# EasyEDA Pro project ProPrj_RUSH - SATURN - v3_2026-11-09.epro

# Schematic Schematic1
Board Name: Board1; Create Date: 2026-11-04; Page Name: P1; Project Name: RUSH - corrigido; Schematic Name: Schematic1; Update Date: 2026-11-06; Company: EasyEDA.com; Drawn: Erick; Page Size: A4; Version: V1.0
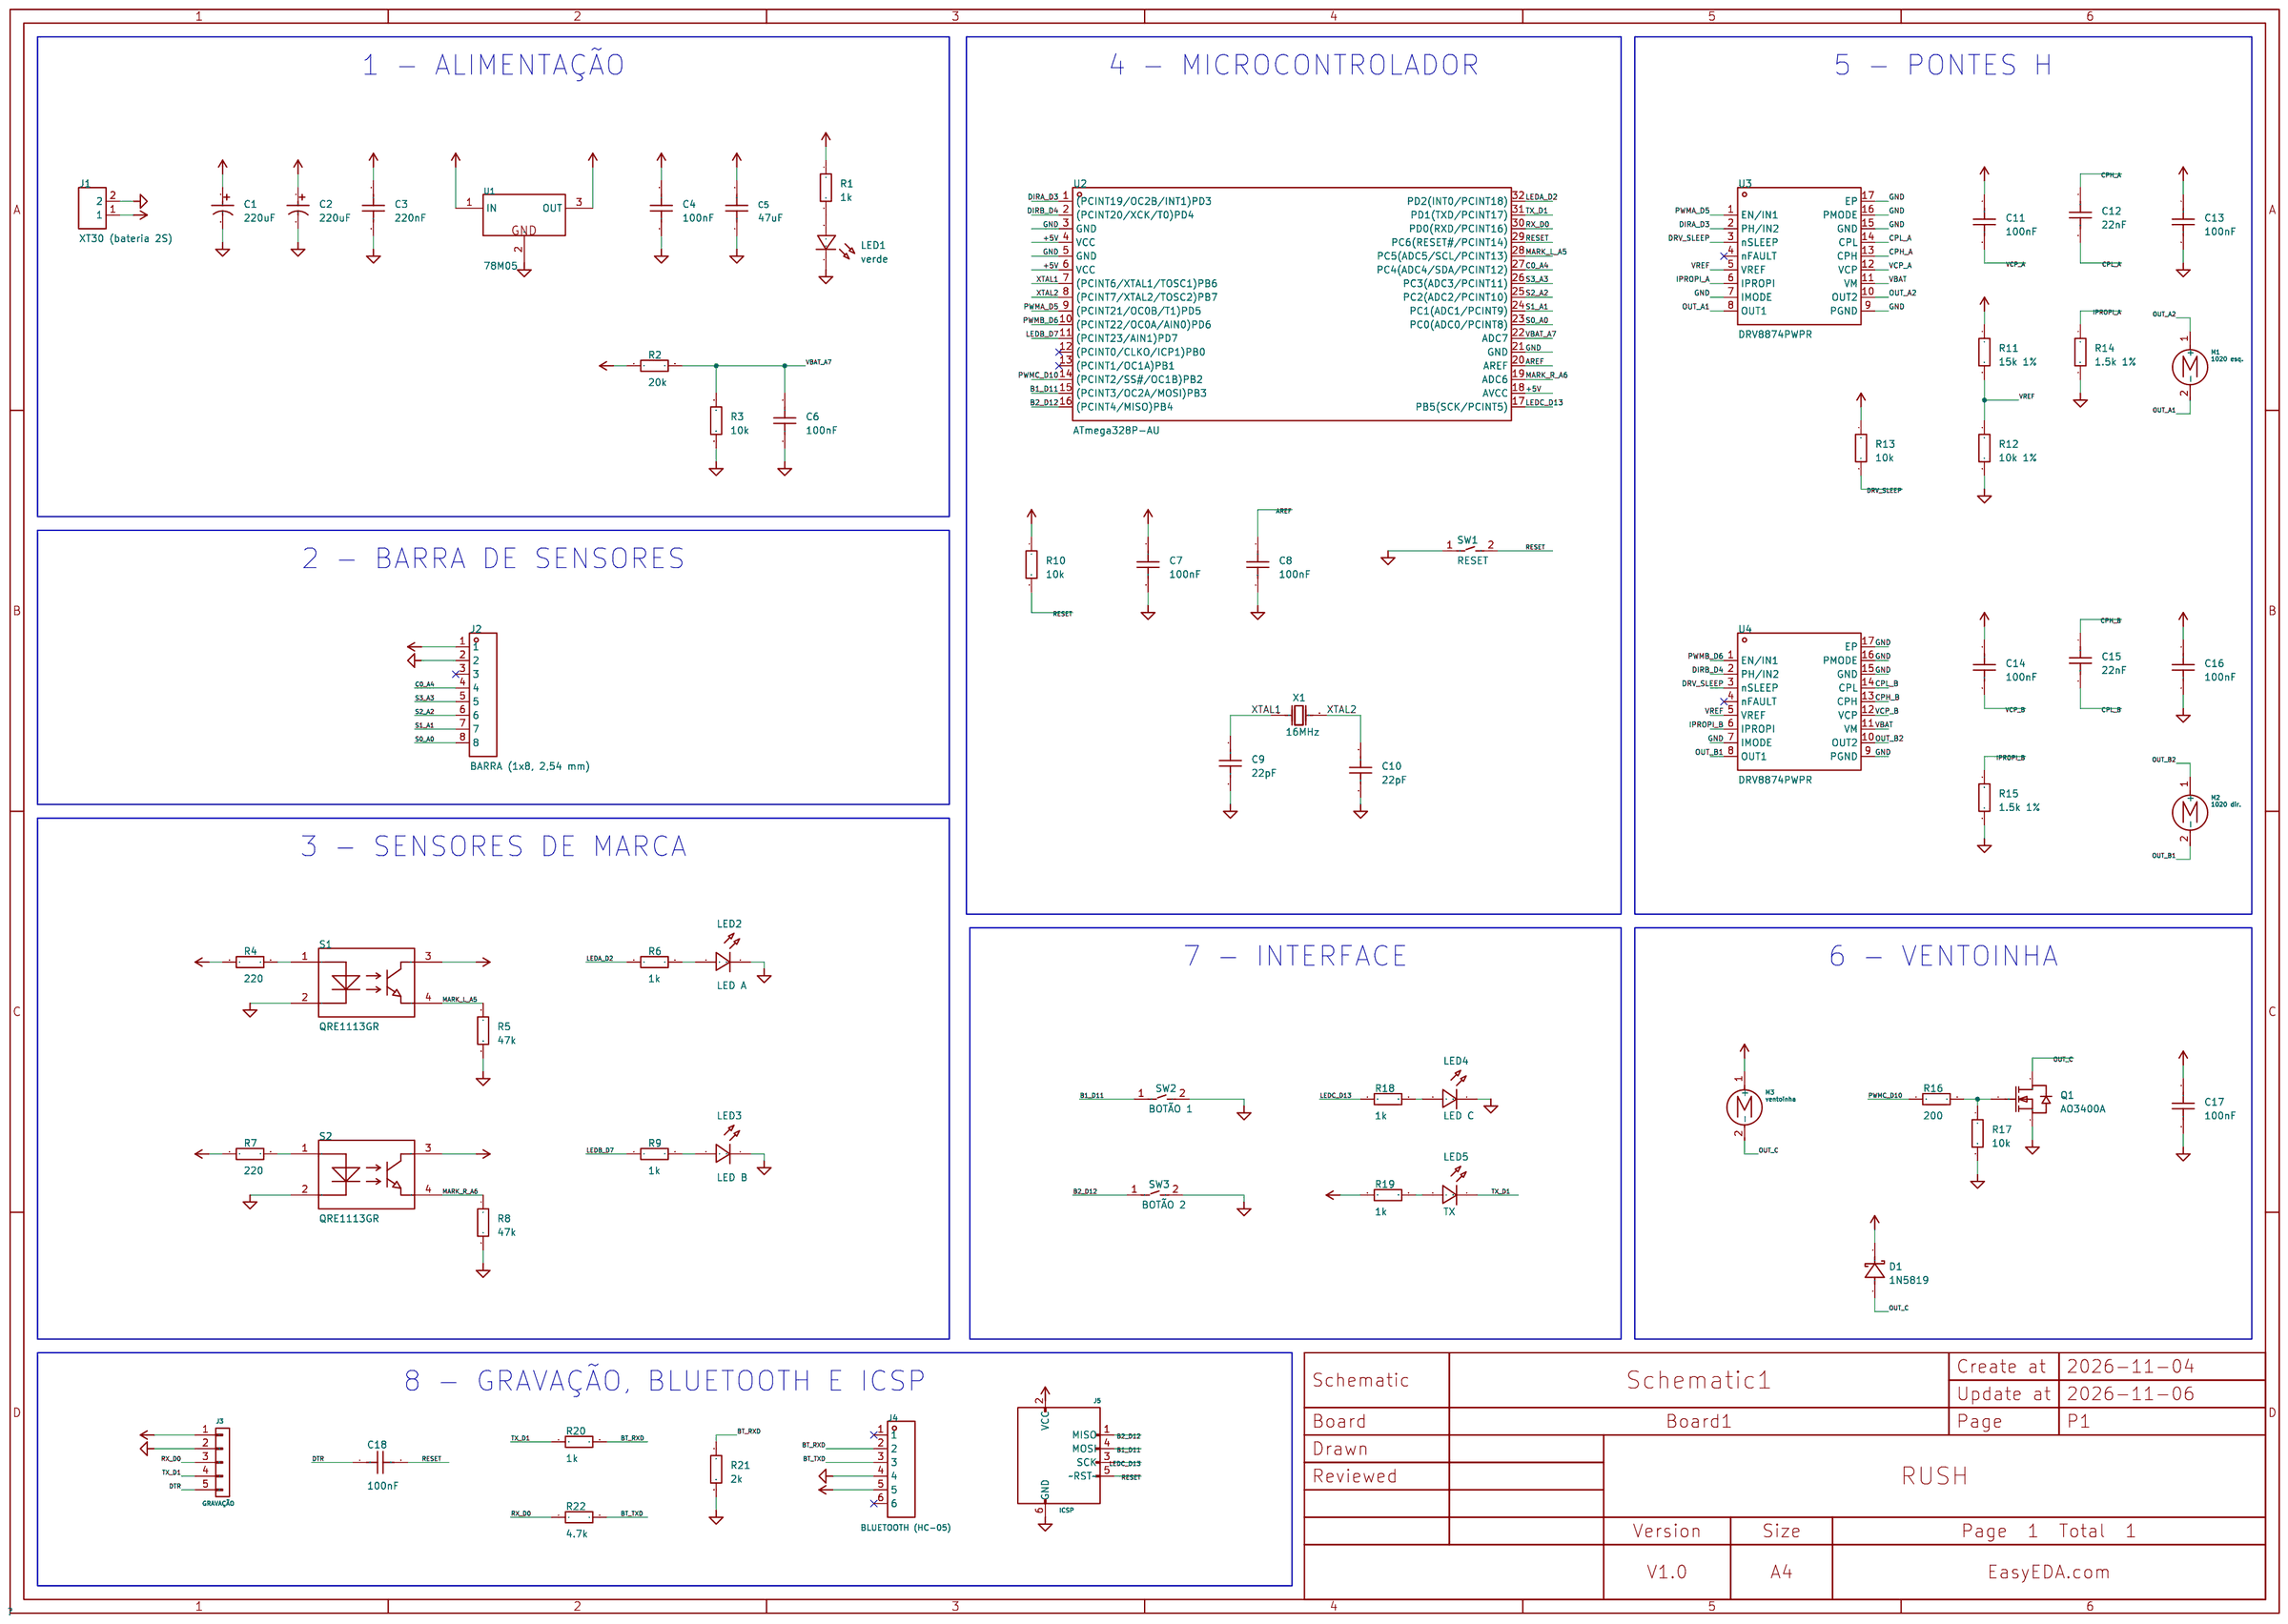
[diagram p0: schematic sheet]

## Parts
C1  220uF  [CAP-TH_BD6.3-P2.50-D1.0-FD]
C2  220uF  [CAP-TH_BD6.3-P2.50-D1.0-FD]
C3  220nF  [C0603]
C4  100nF  [C0603]
C5  47uF  [C1210]
C6  100nF  [C0603]
C7  100nF  [C0603]
C8  100nF  [C0603]
C9  22pF  [C0603]
C10  22pF  [C0603]
C11  100nF  [C0603]
C12  22nF  [C0603]
C13  100nF  [C0603]
C14  100nF  [C0603]
C15  22nF  [C0603]
C16  100nF  [C0603]
C17  100nF  [C0603]
C18  100nF  [C0603]
D1  1N5819  [SOD-123_L2.7-W1.6-LS3.7-RD-1]
J1  XT30 (bateria 2S)  [CONN-TH_XT30U-M]
J2  BARRA (1x8, 2,54 mm)  [HDR-TH_8P-P2.54-V-M]
J3  GRAVAÇÃO  [seguidor_alpha:HDR_1x05_P2.54_SMD_DEITADA]
J4  BLUETOOTH (femea 1x6, ordem HC-05)  [HDR-TH_6P-P2.54-V-F]
J5  ICSP  [seguidor_alpha:ICSP_6P_SMD_BOT]
LED1  verde  [LED0603-RD_GREEN]
LED2  LED A  [LED0603-RD_GREEN]
LED3  LED B  [LED0603-RD_GREEN]
LED4  LED C  [LED0603-RD_GREEN]
LED5  TX  [LED0603-RD_GREEN]
M1  1020 esq.  [seguidor_alpha:MOTOR_1020_2P]
M2  1020 dir.  [seguidor_alpha:MOTOR_1020_2P]
M3  ventoinha  [seguidor_alpha:MOTOR_1020_2P]
Q1  AO3400A  [SOT-23-3_L2.9-W1.3-P1.90-LS2.4-BR]
R1  1k  [R0603]
R2  20k 1%  [R0603]
R3  10k 1%  [R0603]
R4  220  [R0603]
R5  47k  [R0603]
R6  1k  [R0603]
R7  220  [R0603]
R8  47k  [R0603]
R9  1k  [R0603]
R10  10k  [R0603]
R11  15k 1%  [R0603]
R12  10k 1%  [R0603]
R13  10k  [R0603]
R14  1.5k 1%  [R0603]
R15  1.5k 1%  [R0603]
R16  200  [R0603]
R17  10k  [R0603]
R18  1k  [R0603]
R19  1k  [R0603]
R20  1k  [R0603]
R21  2k  [R0603]
R22  4.7k  [R0603]
S1  QRE1113GR  [OPTO-SMD_QRE1113GR]
S2  QRE1113GR  [OPTO-SMD_QRE1113GR]
SW1  RESET  [KEY-SMD_L6.1-W3.7-LS8.0-2]
SW2  BOTÃO 1  [KEY-SMD_L6.1-W3.7-LS8.0-2]
SW3  BOTÃO 2  [KEY-SMD_L6.1-W3.7-LS8.0-2]
U1  78M05  [TO-252-2_L6.5-W6.1-P4.58-LS10.0-TL]
U2  ATmega328P-AU  [TQFP-32_L7.0-W7.0-P0.80-LS9.0-BL]
U3  DRV8874PWPR  [HTSSOP-16_L5.0-W4.4-P0.65-LS6.4-BL-EP]
U4  DRV8874PWPR  [HTSSOP-16_L5.0-W4.4-P0.65-LS6.4-BL-EP]
X1  16MHz  [CRYSTAL-SMD_L5.0-W3.2]

## Library data of the parts
C1 C2 = KM221M025E110A: entre os pes da carcaca, como no EVA-RT; LCSC Part Name: 220uF ±20% 25V; Supplier Part: C59416; Manufacturer: CapXon(丰宾); Supplier Footprint: 插件,D6.3xL11mm; JLCPCB Part Class: Extended Part; Datasheet: https://item.szlcsc.com/datasheet/KM221M025E110A/60469.html; Supplier: LCSC; Tolerance: ±20%; Voltage Rating: 25V; Ripple Current: 235mA@120Hz; Pin Spacing: 2.5mm; Diameter: 6.3mm; Height - Seated (Max): 11mm; Lifetime: 2000hrs@105℃; Operating Temperature: -40℃~+105℃; Polarity type: Polarized; Encapsulamento: eletrolitico 25 V, radial D6,3 mm P2,5; DNP: no
C3 = CAP_0603: Supplier Footprint: 0603; Encapsulamento: 0603 50 V; DNP: no; Voltage Rating: 50V
C4 C9 C10 = CAP_0603: Supplier Footprint: 0603; Encapsulamento: 0603; DNP: no; Voltage Rating: 16V
C5 = GRM32ER61A476KE20L: Capacitance:47uF Tolerance:±10% Tolerance:±10% Voltage Rating:10V Temperature Coefficient:X5R; LCSC Part Name: 47uF ±10% 10V; Supplier Part: C397312; Manufacturer: muRata(村田); Supplier Footprint: 1210; JLCPCB Part Class: Extended Part; Datasheet: https://item.szlcsc.com/datasheet/GRM32ER61A476KE20L/378872.html; Supplier: LCSC; Tolerance: ±10%; Voltage Rating: 10V; Temperature Coefficient: X5R
C6 = CAP_0603: filtro da medicao (opcional); Supplier Footprint: 0603; Encapsulamento: 0603; DNP: no; Voltage Rating: 16V
C7 = CAP_0603: junto aos pinos VCC; Supplier Footprint: 0603; Encapsulamento: 0603; DNP: no; Voltage Rating: 16V
C8 = CAP_0603: AREF (referencia = AVCC no firmware); Supplier Footprint: 0603; Encapsulamento: 0603; DNP: no; Voltage Rating: 16V
C11 C14 = CAP_0603: VCP -> VM; Supplier Footprint: 0603; Encapsulamento: 0603 16 V X7R; DNP: no; Voltage Rating: 16V
C12 C15 = CAP_0603: CPH -> CPL (tensao >= VM); Supplier Footprint: 0603; Encapsulamento: 0603 50 V X7R; DNP: no; Voltage Rating: 50V
C13 C16 = CAP_0603: VM, junto ao pino 11; Supplier Footprint: 0603; Encapsulamento: 0603 25 V X7R; DNP: no; Voltage Rating: 25V
C17 = CAP_0603: Supplier Footprint: 0603; Encapsulamento: 0603 25 V; DNP: no; Voltage Rating: 25V
C18 = CAP_0603: reset automatico pelo DTR; Supplier Footprint: 0603; Encapsulamento: 0603; DNP: no; Voltage Rating: 16V
D1 = 1N5819HW: diodo de roda livre (novo; o EVA-RT nao tem); LCSC Part Name: 电压:40V 电流:1A; Supplier Part: C2905649; Manufacturer: TECH PUBLIC(台舟); Supplier Footprint: SOD-123; JLCPCB Part Class: Extended Part; Datasheet: https://item.szlcsc.com/datasheet/1N5819HW/3175946.html; Supplier: LCSC; Voltage - Forward(Vf@If): 900mV@3A; Voltage - DC Reverse(Vr): 40V; Current - Rectified: 1A; Reverse Leakage Current (Ir): 1mA@40V; Non-Repetitive Peak Forward Surge Current: 9A; Encapsulamento: SOD-123 (B5819W) ou 1N5819 nos terminais do motor; DNP: no
J1 = XT30U-M.G.B: pino 1 = +, pino 2 = -; LCSC Part Name: AMASS(艾迈斯)模插头锂电池插头电机控制器充电器电池接头连接器焊接 2芯锂电插头 黑色 公头15AXT30U-M.G.B; Supplier Part: C19268020; Manufacturer: AMASS(艾迈斯); JLCPCB Part Class: Extended Part; Datasheet: https://item.szlcsc.com/datasheet/XT30U-M.G.B/20526031.html; Supplier: LCSC; Encapsulamento: XT30PW-M de placa ou rabicho XT30; DNP: no
J2 = 2.54-1*8: Pin Structure:1x8P Pitch:2.54mm Circluar Pins/Square Pins:Pin Header Mounting Type:Through Hole Number of Rows:1 Number of Pins:8P Current Rating:2.5A Length of Mating Pin:6mm Insulation Height:2.54mm Length of End Connection Pin:3mm Contact Material:Bras; LCSC Part Name: 1x8P 间距:2.54mm 方针 直插; Supplier Part: C5156616; Manufacturer: ZHOURI(洲日); Supplier Footprint: 插件,P=2.54mm; JLCPCB Part Class: Extended Part; Datasheet: https://item.szlcsc.com/datasheet/2.54-1*8/5790716.html; Supplier: LCSC; Pin Structure: 1x8P; Pitch: 2.54mm; Circluar Pins/Square Pins: Pin Header; Mounting Type: Through Hole; Number of Rows: 1; Number of Pins: 8P; Current Rating: 2.5A; Length of Mating Pin: 6mm; Insulation Height: 2.54mm; Length of End Connection Pin: 3mm; Contact Material: Brass; Contact Plating: Gold; Operating Temperature: -40℃~+105℃; Encapsulamento: barra de pinos 1x8 2,54 mm; DNP: no
J3 = Connector_Generic_Conn_01x05: 1=+5V, 2=GND, 3=RX_D0, 4=TX_D1, 5=DTR. Face inferior no layout.; Encapsulamento: 5 pads SMD, passo 2,54 mm; montagem na face inferior; DNP: no
J4 = 2.54-1*6P母: frente direita, x = 32,5; HC-06 nas vias 2-5 (virado); LCSC Part Name: 1x6P 间距:2.54mm 直插; Supplier Part: C40877; Manufacturer: BOOMELE(博穆精密); Supplier Footprint: 插件,P=2.54mm; JLCPCB Part Class: Extended Part; Datasheet: https://item.szlcsc.com/datasheet/2.54-1*6P%25E6%25AF%258D/41861.html; Supplier: LCSC; Holes Structure: 1x6P; Pitch: 2.54mm; Circular Hole / Square Hole: Square Hole; Mounting Type: Through Hole; Number of Rows: 1; Number of Positions: 6P; Current Rating: 3A; Holes Direction: Top; Insulation Height: 8.5mm; Contact Material: Brass; Contact Plating: Gold; Operating Temperature: -40℃~+105℃; PIN Length: 3.2mm; Encapsulamento: barra femea 1x6 2,54 mm; DNP: no
J5 = Connector_AVR-ISP-6: posicoes do EVA-RT: x 33,97/36,51; y -8,36/-10,90/-13,44; Encapsulamento: 6 pads SMD D1,8 em grade 2,54; DNP: no
LED1 = LED_0603-G: indica 5 V presente; Encapsulamento: 0603; DNP: no
LED2 LED3 LED5 = LED_0603-G: Encapsulamento: 0603; DNP: no
LED4 = LED_0603-G: vermelho; o LED3 em paralelo do EVA-RT foi retirado; Encapsulamento: 0603; DNP: no
M1 M2 = Motor_Motor_DC: coreless 1020 7,4 V; se girar ao contrario, inverta os fios; Encapsulamento: 2 pads; DNP: no
M3 = Motor_Motor_DC: coreless 1020 7,4 V; Encapsulamento: 2 pads; DNP: no
Q1 = AO3400A_C20917: no lugar do IRFR3411/RM10N100LD; liga totalmente com 5 V no gate; LCSC Part Name: N沟道 耐压:30V; Supplier Part: C20917; Manufacturer: AOS; Supplier Footprint: SOT-23; JLCPCB Part Class: Basic Part; Datasheet: https://item.szlcsc.com/datasheet/AO3400A/21629.html; Supplier: LCSC; Number: 1 N-channel; Drain to Source Voltage: 30V; Current - Continuous Drain(Id): 5.7A; RDS(on): 48mΩ@2.5V; Pd - Power Dissipation: 1.4W; Gate Threshold Voltage (Vgs(th)): 1.45V; Gate Charge(Qg): 7nC@10V; Input Capacitance(Ciss): 630pF; Reverse Transfer Capacitance (Crss@Vds): 50pF; Operating Temperature: -55℃~+150℃; Type: N-Channel; Output Capacitance(Coss): 75pF; Vgs: ±12V; Encapsulamento: SOT-23 (1 = G, 2 = S, 3 = D); DNP: no
R1 R4-R9 R18 R19 = Res_0603: Supplier Footprint: 0603; Encapsulamento: 0603; DNP: no
R2 R3 = Res_0603: medicao da bateria (opcional); Supplier Footprint: 0603; Encapsulamento: 0603; DNP: no
R10 = Res_0603: EVA-RT usava 1k; 10k com reset automatico por DTR; Supplier Footprint: 0603; Encapsulamento: 0603; DNP: no
R11 R12 = Res_0603: VREF = 2,0 V; Supplier Footprint: 0603; Encapsulamento: 0603; DNP: no
R13 = Res_0603: nSLEEP sempre alto (pull-down interno de 100k); Supplier Footprint: 0603; Encapsulamento: 0603; DNP: no
R14 R15 = Res_0603: IPROPI -> limite de corrente; Supplier Footprint: 0603; Encapsulamento: 0603; DNP: no
R16 = Res_0603: gate; Supplier Footprint: 0603; Encapsulamento: 0603; DNP: no
R17 = Res_0603: gate -> GND (desligado no boot); Supplier Footprint: 0603; Encapsulamento: 0603; DNP: no
R20 R21 = Res_0603: divisor 5 V -> 3,3 V; Supplier Footprint: 0603; Encapsulamento: 0603; DNP: no
R22 = Res_0603: 4,7k: grava com o HC-05 encaixado (sem LED de RX); Supplier Footprint: 0603; Encapsulamento: 0603; DNP: no
S1 S2 = QRE1113GR: datasheet: 1 = anodo, 2 = catodo, 3 = coletor, 4 = emissor; LCSC Part Name: 微型反射式物体传感器; Supplier Part: C232862; Manufacturer: onsemi(安森美); Supplier Footprint: SMD-4P; JLCPCB Part Class: Extended Part; Datasheet: https://item.szlcsc.com/datasheet/QRE1113GR/232660.html; Supplier: LCSC; Sensing Distance: 1mm; Voltage - Forward(Vf): 1.2V; C-E Saturation Voltage: 30V; Current - Collector(Ic): 20mA; Reverse Pressure (Typ): 5V; Forward Current(If): 50mA; Wavelength: 940nm; Output Type: Phototransistor; Vce Saturation(VCE(sat)): 0.3V@If=20mA,Ic=50uA; Rise time: 20us@Vcc=5V,Ic=100uA,Rl=1kΩ; Fall time: 20us@Vcc=5V,Ic=100uA,Rl=1kΩ; Power Dissipation(Pd): 50mW; Operating Temperature: -40℃~+85℃; Encapsulamento: SMD 4 pinos; DNP: no
SW1-SW3 = TVBM17-025CF-R: Circuit:SPST Actuator Style:Rectangular Button Mounting Type:Surface Mount,Vertical Length:6.1mm Width:3.7mm Switch Height:2.5mm with Bracket:Without Bracket Contact Current:50mA Voltage Rating:12V With Lamp:No Termination Style:Gull Wing Operating Temper; LCSC Part Name: 一型/贴片/2.5H/250gf/黑底PPA白钮/防尘/编带; Supplier Part: C19271064; Manufacturer: jianfu(键富); Supplier Footprint: SMD,6.1x3.7mm; JLCPCB Part Class: Extended Part; Datasheet: https://item.szlcsc.com/datasheet/TVBM17-025CF-R/20539419.html; Supplier: LCSC; Circuit: SPST; Actuator Style: Rectangular Button; Mounting Type: Surface Mount,Vertical; Length: 6.1mm; Width: 3.7mm; Switch Height: 2.5mm; with Bracket: Without Bracket; Contact Current: 50mA; Voltage Rating: 12V; With Lamp: No; Termination Style: Gull Wing; Operating Temperature: -40℃~+85℃
U1 = 78M05_C111265: Output Configuration:Positive Voltage - Supply:35V Output Voltage:5V Output Voltage:5V Output Current:500mA Power Supply Rejection Ratio (PSRR):78dB@(120Hz) Voltage Dropout:2V@(500mA) standby current:6mA Noise:- Features:- Operating Temperature:-40℃~+125℃; LCSC Part Name: 5V 500mA 35V; Supplier Part: C111265; Manufacturer: SHIKUES(时科); Supplier Footprint: TO-252-2(DPAK); JLCPCB Part Class: Extended Part; Datasheet: https://item.szlcsc.com/datasheet/78M05/112491.html; Supplier: LCSC; Output Configuration: Positive; Voltage - Supply: 35V; Output Voltage: 5V; Output Current: 500mA; Power Supply Rejection Ratio (PSRR): 78dB@(120Hz); Voltage Dropout: 2V@(500mA); standby current: 6mA; Operating Temperature: -40℃~+125℃; Output Type: Fixed; Number of Outputs: 1; Encapsulamento: TO-252 (DPAK); DNP: no
U2 = ATMEGA328P-AU_C14877: do Nano/Uno doador (com bootloader) ou novo + bootloader pelo ICSP; LCSC Part Name: 基于AVR增强型RISC架构的低功耗CMOS 8位微控制器; Supplier Part: C14877; Manufacturer: MICROCHIP(美国微芯); Manufacturer Part: ATMEGA328P-AU; Supplier Footprint: TQFP-32(7x7); JLCPCB Part Class: Extended Part; Datasheet: https://item.szlcsc.com/datasheet/ATMEGA328P-AU/15549.html; Supplier: LCSC; CPU Core: AVR; CPU Maximum Speed: 20MHz; Core Size: 8 Bit; Program Storage Size: 32KB; Program Memory Type: FLASH; RAM Size: 2KB; EEPROM: 1KB; Number of I/O: 23; ADC (Bit): 10bit; Oscillator Type: Built-in; Voltage - Supply: 1.8V~5.5V; Operating Temperature: -40℃~+85℃; Features: External pin reset (NRST)；Built-in general-purpose timer；Power-on reset (POR)；Touch function；Undervoltage detection (BOR/LVD/LVR/LVI)；Programmable watchdog; Encapsulamento: TQFP-32; DNP: no
U3 = DRV8874PWPR: esq.; LCSC Part Name: 6A 有刷直流电机驱动芯片 4.5V~37V; Supplier Part: C1855818; Manufacturer: TI(德州仪器); Supplier Footprint: HTSSOP-16-EP; JLCPCB Part Class: Extended Part; Datasheet: https://www.ti.com/cn/lit/ds/symlink/drv8874.pdf; Supplier: LCSC; Technology: Yes; Number of H-bridges: 1; Peak Current: 6A; RDS(on): 200mΩ; Quiescent Current(Iq): 750nA; Operating Temperature: -40℃~+125℃; Features: Interleaved conduction protection；Current sensing/regulation function; Encapsulamento: HTSSOP-16 (PWP), pad termico com vias; DNP: no
U4 = DRV8874PWPR: dir.; LCSC Part Name: 6A 有刷直流电机驱动芯片 4.5V~37V; Supplier Part: C1855818; Manufacturer: TI(德州仪器); Supplier Footprint: HTSSOP-16-EP; JLCPCB Part Class: Extended Part; Datasheet: https://www.ti.com/cn/lit/ds/symlink/drv8874.pdf; Supplier: LCSC; Technology: Yes; Number of H-bridges: 1; Peak Current: 6A; RDS(on): 200mΩ; Quiescent Current(Iq): 750nA; Operating Temperature: -40℃~+125℃; Features: Interleaved conduction protection；Current sensing/regulation function; Encapsulamento: HTSSOP-16 (PWP), pad termico com vias; DNP: no
X1 = 7A-16.000MAAJ-T: Frequency:16MHz Normal temperature Frequency Tolerance:±30ppm Normal temperature Frequency Tolerance:±30ppm Load Capacitor: Frequency Stability(Full temperature range):±30ppm Frequency Stability(Full temperature range):±30ppm Equivalent Series Resistance; LCSC Part Name: 16MHz ±30ppm 18pF; Supplier Part: C2450102; Manufacturer: TXC(晶技); Supplier Footprint: SMD5032; JLCPCB Part Class: Extended Part; Datasheet: https://atta.szlcsc.com/upload/public/pdf/source/20180326/C97724_C4EFF7A16D0E132C961AD7AA14FCEEAA.pdf; Supplier: LCSC; Normal temperature Frequency Tolerance: ±30ppm; Frequency Stability(Full temperature range): ±30ppm; Equivalent Series Resistance (ESR): 50Ω

## Nets
+5V: C4.1 C5.2 C7.1 J2.1 J3.1(Pin) J4.5 J5.2(VCC) R1.1 R4.1 R7.1 R10.1 R11.1 R13.1 R19.1 S1.3(C) S2.3(C) U1.3(OUT) U2.4(VCC) U2.6(VCC) U2.18(AVCC)
GND: C1.2 C2.2 C3.2 C4.2 C5.1 C6.2 C7.2 C8.2 C9.2 C10.2 C13.2 C16.2 C17.2 J1.2 J2.2 J3.2(Pin) J4.4 J5.6(GND) LED1.1(C) LED2.1(C) LED3.1(C) LED4.1(C) Q1.2(S) R3.2 R5.2 R8.2 R12.2 R14.2 R15.2 R17.2 R21.2 S1.2 S2.2 SW1.1 SW2.2 SW3.2 U1.2(GND) U2.3(GND) U2.5(GND) U2.21(GND) U3.7(IMODE) U3.9(PGND) U3.15(GND) U3.16(PMODE) U3.17(EP) U4.7(IMODE) U4.9(PGND) U4.15(GND) U4.16(PMODE) U4.17(EP)
VBAT: C1.1 C2.1 C3.1 C11.1 C13.1 C14.1 C16.1 C17.1 D1.1(K) J1.1 M3.1(+) R2.1 U1.1(IN) U3.11(VM) U4.11(VM)
VBAT_A7: C6.1 R2.2 R3.1 U2.22(ADC7)
AREF: C8.1 U2.20(AREF)
B1_D11: J5.4(MOSI) SW2.1 U2.15((PCINT3/OC2A/MOSI)PB3)
B2_D12: J5.1(MISO) SW3.1 U2.16((PCINT4/MISO)PB4)
BT_RXD: J4.2 R20.2 R21.1
BT_TXD: J4.3 R22.2
C0_A4: J2.4 U2.27(PC4(ADC4/SDA/PCINT12))
CPH_A: C12.1 U3.13(CPH)
CPH_B: C15.1 U4.13(CPH)
CPL_A: C12.2 U3.14(CPL)
CPL_B: C15.2 U4.14(CPL)
DIRA_D3: U2.1((PCINT19/OC2B/INT1)PD3) U3.2(PH/IN2)
DIRB_D4: U2.2((PCINT20/XCK/T0)PD4) U4.2(PH/IN2)
DRV_SLEEP: R13.2 U3.3(nSLEEP) U4.3(nSLEEP)
DTR: C18.1 J3.5(Pin)
IPROPI_A: R14.1 U3.6(IPROPI)
IPROPI_B: R15.1 U4.6(IPROPI)
LEDA_D2: R6.1 U2.32(PD2(INT0/PCINT18))
LEDB_D7: R9.1 U2.11((PCINT23/AIN1)PD7)
LEDC_D13: J5.3(SCK) R18.1 U2.17(PB5(SCK/PCINT5))
MARK_L_A5: R5.1 S1.4(E) U2.28(PC5(ADC5/SCL/PCINT13))
MARK_R_A6: R8.1 S2.4(E) U2.19(ADC6)
OUT_A1: M1.2(-) U3.8(OUT1)
OUT_A2: M1.1(+) U3.10(OUT2)
OUT_B1: M2.2(-) U4.8(OUT1)
OUT_B2: M2.1(+) U4.10(OUT2)
OUT_C: D1.2(A) M3.2(-) Q1.3(D)
PWMA_D5: U2.9((PCINT21/OC0B/T1)PD5) U3.1(EN/IN1)
PWMB_D6: U2.10((PCINT22/OC0A/AIN0)PD6) U4.1(EN/IN1)
PWMC_D10: R16.1 U2.14((PCINT2/SS#/OC1B)PB2)
RESET: C18.2 J5.5(~RST~) R10.2 SW1.2 U2.29(PC6(RESET#/PCINT14))
RX_D0: J3.3(Pin) R22.1 U2.30(PD0(RXD/PCINT16))
S0_A0: J2.8 U2.23(PC0(ADC0/PCINT8))
S1_A1: J2.7 U2.24(PC1(ADC1/PCINT9))
S2_A2: J2.6 U2.25(PC2(ADC2/PCINT10))
S3_A3: J2.5 U2.26(PC3(ADC3/PCINT11))
TX_D1: J3.4(Pin) LED5.1(C) R20.1 U2.31(PD1(TXD/PCINT17))
VCP_A: C11.2 U3.12(VCP)
VCP_B: C14.2 U4.12(VCP)
VREF: R11.2 R12.1 U3.5(VREF) U4.5(VREF)
XTAL1: C9.1 U2.7((PCINT6/XTAL1/TOSC1)PB6) X1.1(OSC1)
XTAL2: C10.1 U2.8((PCINT7/XTAL2/TOSC2)PB7) X1.2(OSC2)
$1N2048: R4.2 S1.1
$1N2069: R7.2 S2.1
$1N2070: LED1.2(A) R1.2
$1N2073: LED2.2(A) R6.2
$1N2082: LED3.2(A) R9.2
$1N2129: LED4.2(A) R18.2
$1N2130: LED5.2(A) R19.2
$1N2219: Q1.1(G) R16.2 R17.1

Not connected (* = marked no-connect by the designer): J2 3*; J4 1* 6*; U2 12((PCINT0/CLKO/ICP1)PB0)* 13((PCINT1/OC1A)PB1)*; U3 4(nFAULT)*; U4 4(nFAULT)*

## Notes on the sheet
- 1 - ALIMENTAÇÃO
- 4 - MICROCONTROLADOR
- 5 - PONTES H
- 2 - BARRA DE SENSORES
- 3 - SENSORES DE MARCA
- 7 - INTERFACE
- 6 - VENTOINHA
- 8 - GRAVAÇÃO, BLUETOOTH E ICSP

# Board PCB1
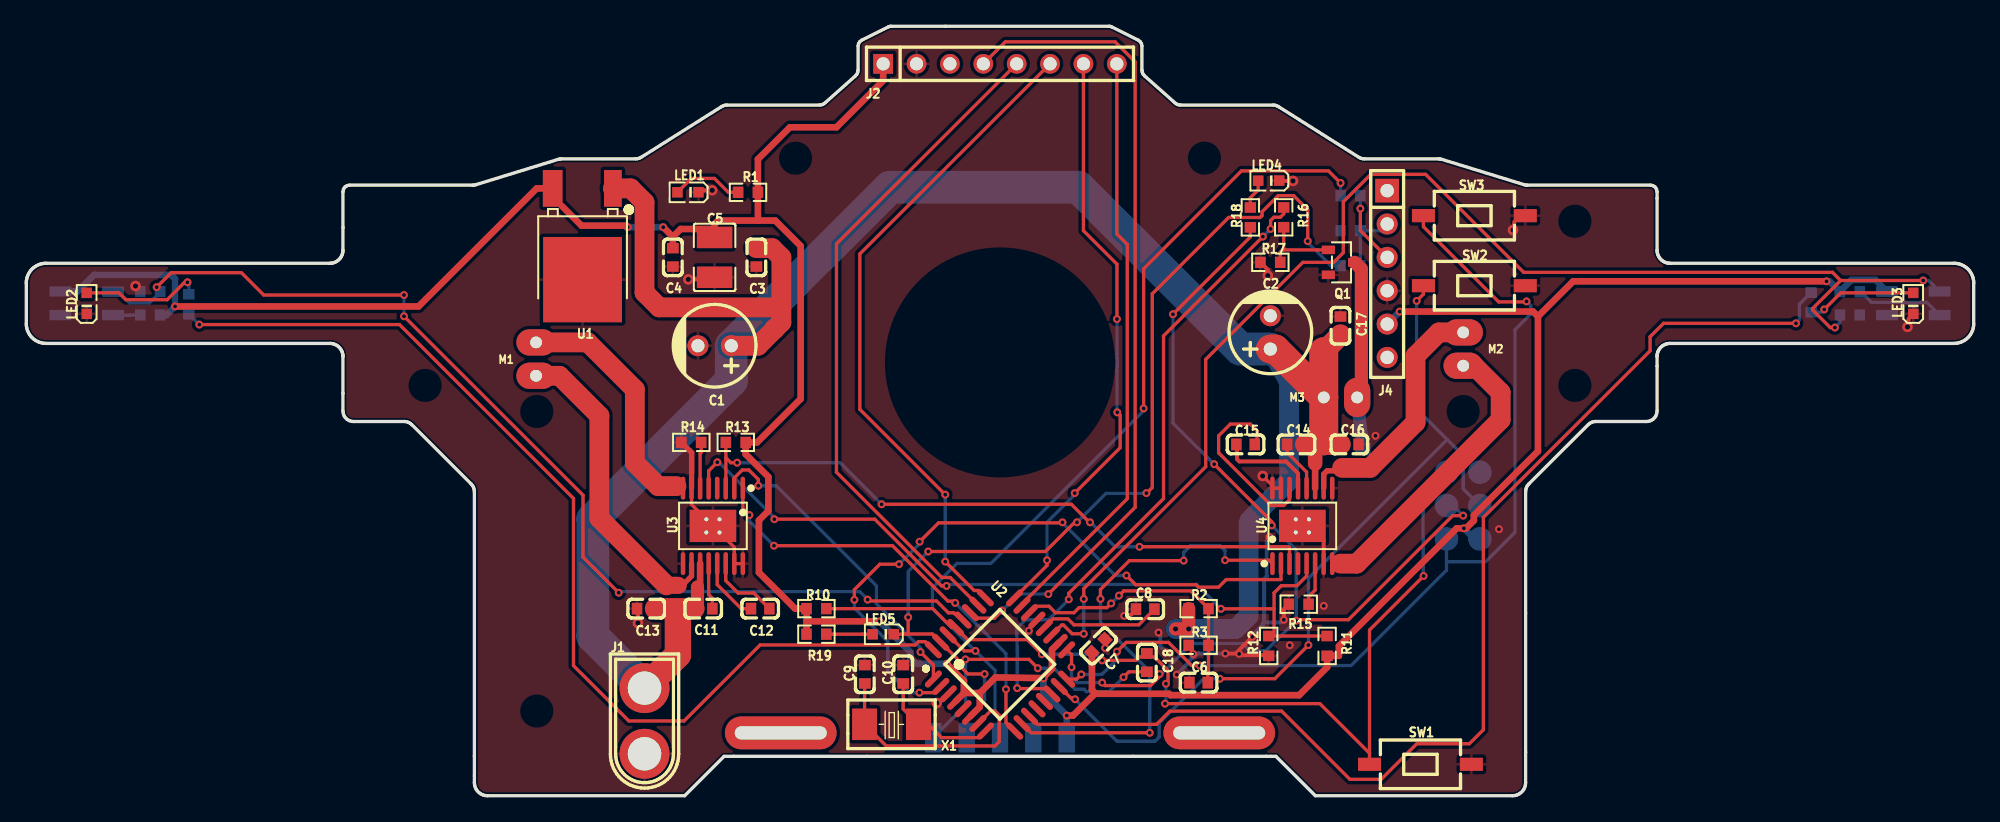
[diagram p1: board, top side]
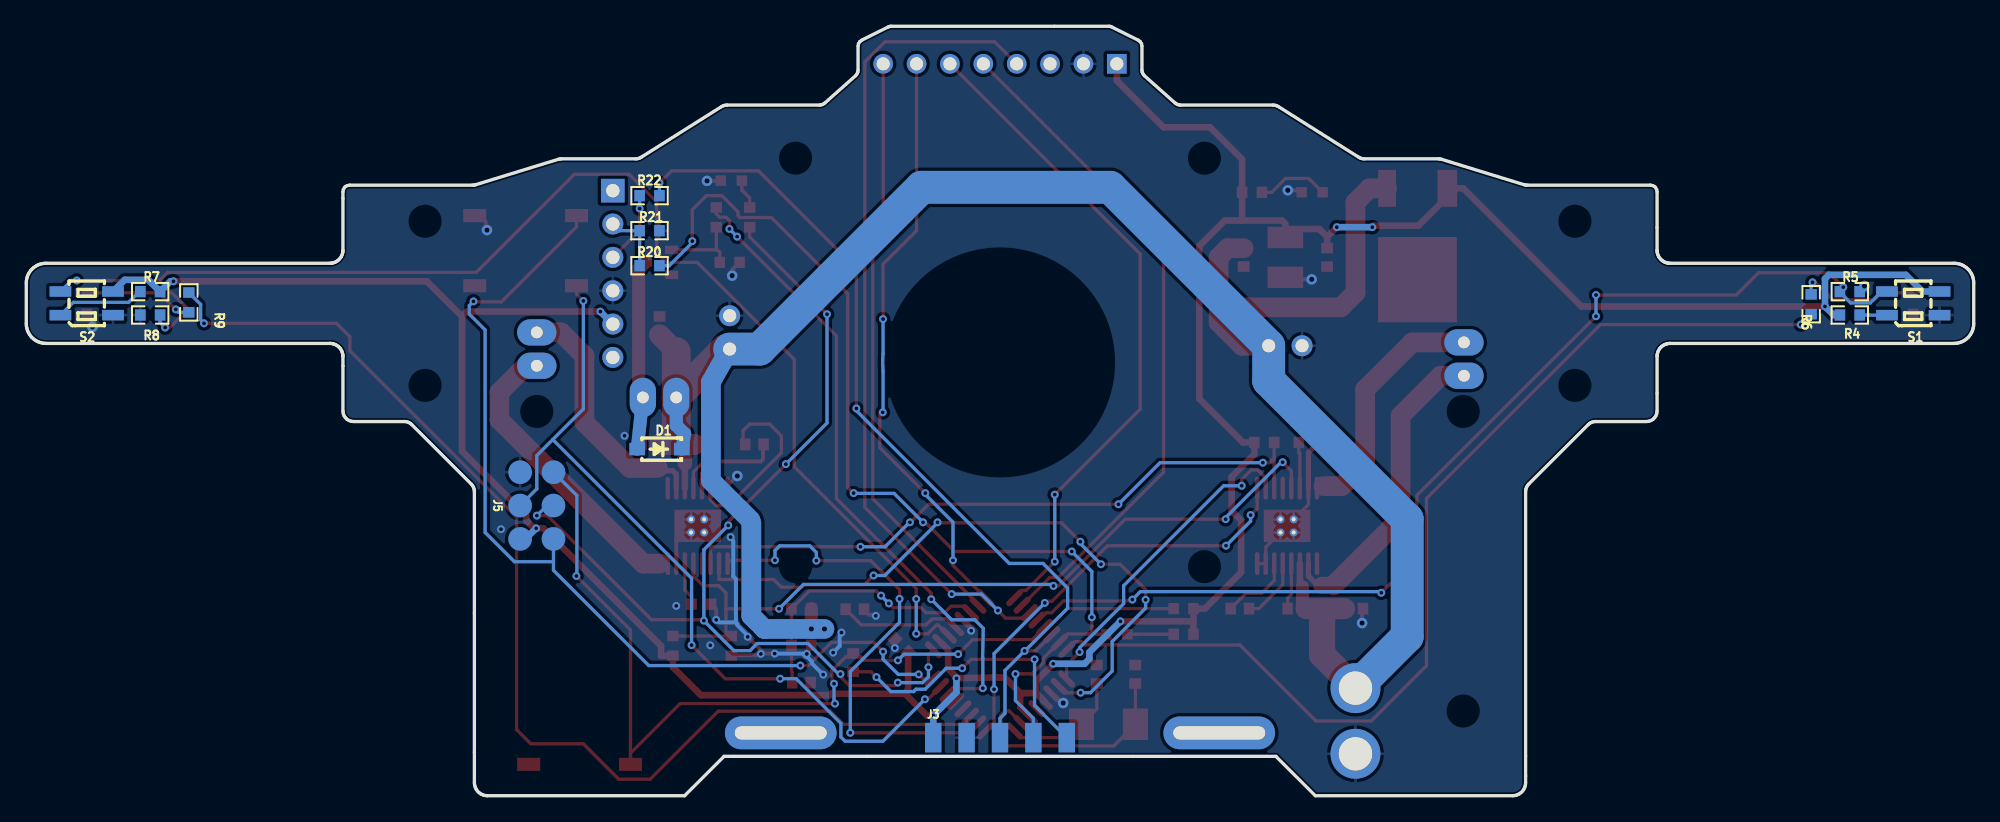
[diagram p2: board, bottom side, seen from below]

Outline 148.2 x 58.6 mm; copper layers: Top Layer, Bottom Layer. Coordinates in mm from the lower left corner of the outline.
Stack: Top Layer 0.035mm / Dielectric1 1.51mm FR4 er 4.5 / Bottom Layer 0.035mm

## Design rules (mm)
spacing copperThickness1oz (default): track to track 0.2, other pairs 0.2 to 0.3
spacing copperThickness2oz: track to track 0.203, other pairs 0.152 to 0.3
spacing Plane_innerPlane: track to track 0.2, other pairs 0.2 to 0.3
spacing Copper_copperRegion: track to track 0.2, other pairs 0.2 to 0.3
track width copperThickness1oz (default): min 0.25, default 0.25, max 3
track width copperThickness2oz: min 0.203, default 0.254, max 2.54
differential pair differentialPair (default): width min 0.127, default 0.254, max 2.54; gap min 0.152, default 0.152
net GND uses Copper_copperRegion, Plane_innerPlane
pour e1418 uses Copper_copperRegion
pour e1559 uses Copper_copperRegion

## Placement (name value [footprint] x y rotation side)
C1  220uF  [CAP-TH_BD6.3-P2.50-D1.0-FD]  52.38 34.27 180 top
C2  220uF  [CAP-TH_BD6.3-P2.50-D1.0-FD]  94.67 35.29 90 top
C3  220nF  [C0603]  55.56 41 270 top
C4  100nF  [C0603]  49.2 41 270 top
C5  47uF  [C1210]  52.38 41 90 top
C6  100nF  [C0603]  89.21 8.62 180 top
C7  100nF  [C0603]  81.59 11.41 45 top
C8  100nF  [C0603]  85.15 14.2 180 top
C9  22pF  [C0603]  63.81 9.25 90 top
C10  22pF  [C0603]  66.73 9.25 90 top
C11  100nF  [C0603]  51.51 14.25 0 top
C12  22nF  [C0603]  55.85 14.25 0 top
C13  100nF  [C0603]  47.18 14.25 180 top
C14  100nF  [C0603]  96.66 26.75 180 top
C15  22nF  [C0603]  92.79 26.75 0 top
C16  100nF  [C0603]  100.69 26.75 0 top
C17  100nF  [C0603]  100.01 35.79 90 top
C18  100nF  [C0603]  85.28 10.14 90 top
D1  1N5819  [SOD-123_L2.7-W1.6-LS3.7-RD-1]  100.01 26.4 0 bottom
J1  XT30 (bateria 2S)  [CONN-TH_XT30U-M]  47.05 5.69 270 top
J2  BARRA (1x8, 2,54 mm)  [HDR-TH_8P-P2.54-V-M]  74.1 55.74 0 top
J3  GRAVAÇÃO  [seguidor_alpha:HDR_1x05_P2.54_SMD_DEITADA]  74.1 4.43 0 bottom
J4  BLUETOOTH (femea 1x6, ordem HC-05)  [HDR-TH_6P-P2.54-V-F]  103.56 39.73 270 top
J5  ICSP  [seguidor_alpha:ICSP_6P_SMD_BOT]  109.35 22.1 0 bottom
LED1  verde  [LED0603-RD_GREEN]  50.35 45.96 180 top
LED2  LED A  [LED0603-RD_GREEN]  4.6 37.5 90 top
LED3  LED B  [LED0603-RD_GREEN]  143.6 37.5 90 top
LED4  LED C  [LED0603-RD_GREEN]  94.55 46.84 180 top
LED5  TX  [LED0603-RD_GREEN]  65.21 12.3 180 top
M1  1020 esq.  [seguidor_alpha:MOTOR_1020_2P]  38.79 33.25 0 top
M2  1020 dir.  [seguidor_alpha:MOTOR_1020_2P]  109.35 34.02 180 top
M3  ventoinha  [seguidor_alpha:MOTOR_1020_2P]  100.01 30.33 270 top
NOREF  -  [Pad_e557]  90.78 4.79 270 top
NOREF#2  -  [Pad_e558]  57.41 4.79 270 top
Q1  AO3400A  [SOT-23-3_L2.9-W1.3-P1.90-LS2.4-BR]  100.09 40.62 180 top
R1  1k  [R0603]  54.92 45.95 180 top
R2  20k 1%  [R0603]  89.21 14.25 0 top
R3  10k 1%  [R0603]  89.21 11.46 180 top
R4  220  [R0603]  9.43 36.61 180 bottom
R5  47k  [R0603]  9.43 38.39 180 bottom
R6  1k  [R0603]  12.37 37.43 90 bottom
R7  220  [R0603]  138.77 38.39 0 bottom
R8  47k  [R0603]  138.77 36.61 0 bottom
R9  1k  [R0603]  135.83 37.57 270 bottom
R10  10k  [R0603]  60.13 14.25 0 top
R11  15k 1%  [R0603]  98.99 11.41 90 top
R12  10k 1%  [R0603]  94.55 11.41 270 top
R13  10k  [R0603]  53.99 26.91 180 top
R14  1.5k 1%  [R0603]  50.6 26.91 180 top
R15  1.5k 1%  [R0603]  96.83 14.58 180 top
R16  200  [R0603]  95.69 44.05 270 top
R17  10k  [R0603]  94.67 40.62 180 top
R18  1k  [R0603]  93.15 44.04 90 top
R19  1k  [R0603]  60.13 12.3 0 top
R20  1k  [R0603]  100.77 40.37 0 bottom
R21  2k  [R0603]  100.77 43.03 180 bottom
R22  4.7k  [R0603]  100.77 45.7 0 bottom
S1  QRE1113GR  [OPTO-SMD_QRE1113GR]  4.6 37.5 180 bottom
S2  QRE1113GR  [OPTO-SMD_QRE1113GR]  143.6 37.5 180 bottom
SW1  RESET  [KEY-SMD_L6.1-W3.7-LS8.0-2]  106.1 2.39 180 top
SW2  BOTÃO 1  [KEY-SMD_L6.1-W3.7-LS8.0-2]  110.2 38.84 0 top
SW3  BOTÃO 2  [KEY-SMD_L6.1-W3.7-LS8.0-2]  110.2 44.18 0 top
U1  78M05  [TO-252-2_L6.5-W6.1-P4.58-LS10.0-TL]  42.35 42.78 270 top
U2  ATmega328P-AU  [TQFP-32_L7.0-W7.0-P0.80-LS9.0-BL]  74.1 10 315 top
U3  DRV8874PWPR  [HTSSOP-16_L5.0-W4.4-P0.65-LS6.4-BL-EP]  52.25 20.55 180 top
U4  DRV8874PWPR  [HTSSOP-16_L5.0-W4.4-P0.65-LS6.4-BL-EP]  97.11 20.55 0 top
X1  16MHz  [CRYSTAL-SMD_L5.0-W3.2]  65.84 5.44 0 top

## Footprints (pads in the part's own frame, mm; a bottom-side part is the same pattern mirrored in y, then rotated)
C0603
  rect 0.8x0.9 smd: 1(-0.7,0) 2(0.7,0)
C1210
  rect 1.635x2.7 smd: 1(-1.518,0) 2(1.518,0)
CAP-TH_BD6.3-P2.50-D1.0-FD
  round 1.6 hole 1: 1(-1.27,0) 2(1.27,0)
CONN-TH_XT30U-M
  round 3.8 hole 2.54: 1(-2.5,0) 2(2.5,0)
CRYSTAL-SMD_L5.0-W3.2
  rect 1.9x2.4 smd: 1(-2.05,0) 2(2.05,0)
HDR-TH_6P-P2.54-V-F
  rect 1.8x1.8 hole 1.02: 1(-6.35,0)
  round 1.6 hole 1.02: 2(-3.81,0) 3(-1.27,0) 4(1.27,0) 5(3.81,0) 6(6.35,0)
HDR-TH_8P-P2.54-V-M
  rect 1.5x1.5 hole 1: 1(-8.89,0)
  round 1.5 hole 1: 2(-6.35,0) 3(-3.81,0) 4(-1.27,0) 5(1.27,0) 6(3.81,0) 7(6.35,0) 8(8.89,0)
HTSSOP-16_L5.0-W4.4-P0.65-LS6.4-BL-EP
  oval 0.343x1.746 smd: 1(-2.275,-2.873) 2(-1.625,-2.873) 3(-0.975,-2.873) 4(-0.325,-2.873) 5(0.325,-2.873) 6(0.975,-2.873) 7(1.625,-2.873) 8(2.275,-2.873) 9(2.275,2.873) 10(1.625,2.873) 11(0.975,2.873) 12(0.325,2.873) 13(-0.325,2.873) 14(-0.975,2.873) 15(-1.625,2.873) 16(-2.275,2.873)
  round 0.61 hole 0.305: 17(-0.5,0.5) 17(-0.5,-0.5) 17(0.5,0.5) 17(0.5,-0.5)
  rect 3.55x2.46 smd: 17(0,0)
KEY-SMD_L6.1-W3.7-LS8.0-2
  rect 1.75x1 smd: 1(-3.875,0) 2(3.875,0)
LED0603-RD_GREEN
  rect 0.8x0.8 smd: 1(-0.799,-0.004) 2(0.799,0.004)
OPTO-SMD_QRE1113GR
  rect 1.66x0.8 smd: 1(-2,-0.9) 2(2,-0.9) 3(2,0.9) 4(-2,0.9)
Pad_e557
  oval 2.5x8.5 hole 1x7: 1(0,0)
Pad_e558
  oval 2.5x8.5 hole 1x7: 1(0,0)
R0603
  rect 0.806x0.864 smd: 1(-0.753,0) 2(0.753,0)
seguidor_alpha:HDR_1x05_P2.54_SMD_DEITADA
  rect 1.25x2.25 smd: 1(5.08,0) 2(2.54,0) 3(0,0) 4(-2.54,0) 5(-5.08,0)
seguidor_alpha:ICSP_6P_SMD_BOT
  round 1.8 smd: 1(-1.27,2.54) 2(1.27,2.54) 3(-1.27,0) 4(1.27,0) 5(-1.27,-2.54) 6(1.27,-2.54)
seguidor_alpha:MOTOR_1020_2P
  oval 3x2 hole 0.9: 1(0,-1.27) 2(0,1.27)
SOD-123_L2.7-W1.6-LS3.7-RD-1
  rect 1.2x0.95 smd: 1(-1.7,0) 2(1.7,0)
SOT-23-3_L2.9-W1.3-P1.90-LS2.4-BR
  rect 1x0.65 smd: 1(1,-0.95) 2(1,0.95) 3(-1,0)
TO-252-2_L6.5-W6.1-P4.58-LS10.0-TL
  rect 2.8x1.35 smd: 1(-3.475,2.29)
  rect 6.5x6 smd: 2(3.475,-0.017)
  rect 2.8x1.5 smd: 3(-3.475,-2.29)
TQFP-32_L7.0-W7.0-P0.80-LS9.0-BL
  oval 0.45x1.65 smd: 1(-2.8,-4.369) 2(-2,-4.369) 3(-1.2,-4.369) 4(-0.4,-4.369) 5(0.4,-4.369) 6(1.2,-4.369) 7(2,-4.369) 8(2.8,-4.369) 17(2.8,4.369) 18(2,4.369) 19(1.2,4.369) 20(0.4,4.369) 21(-0.4,4.369) 22(-1.2,4.369) 23(-2,4.369) 24(-2.8,4.369)
  oval 1.65x0.45 smd: 9(4.381,-2.8) 10(4.381,-2) 11(4.381,-1.2) 12(4.381,-0.4) 13(4.381,0.4) 14(4.381,1.2) 15(4.381,2) 16(4.381,2.8) 25(-4.381,2.8) 26(-4.381,2) 27(-4.381,1.2) 28(-4.381,0.4) 29(-4.381,-0.4) 30(-4.381,-1.2) 31(-4.381,-2) 32(-4.381,-2.8)

## Nets
As in the schematic.

Pads without a net: J2 3; J4 1 6; NOREF 1; NOREF#2 1; U2 12 13; U3 4; U4 4

## Via types
v1: diameter 0.8, hole 0.4, Top Layer to Bottom Layer, 12 vias
v2: diameter 0.6, hole 0.3, Top Layer to Bottom Layer, 111 vias

## Routing (per net, layer and track width the routed paths; a pad name or vN(x,y) marks a point on that pad's centre or on a via; arc(x,y) is an arc through that point)
+5V: length 254.5
  Top Layer w0.5: v2(45.77,43.3) 45.66,43.41 42.26,43.41 40.77,44.9 ; C7.1 81.1,8.05 81.35,7.8 ; R19.1 59.38,13.28 ; 59.38,13.28 R10.1 58.51,14.25 55.75,17 55.75,20.97 56.47,21.69 56.47,24.28 54.74,26.01 R13.1 55.61,26.91 58.93,30.23 58.93,41.87 57,43.8 55.68,43.8 ; 59.38,13.28 v2(64.94,13.28) ; 71.35,7.82 72.56,7.82 ; 71.35,7.82 71.35,8.74 70.05,10.04 v2(70.05,10.05) ; 71.35,7.82 U2.4 ; 72.56,7.82 72.56,6.76 U2.6 ; 72.56,7.82 73.75,9.01 77.34,8.95 77.37,8.98 ; v2(48.47,43.3) 49.07,42.7 ; v2(137,39.18) 117.72,39.18 115.04,36.5 ; v2(104.51,36.87) 114.67,36.87 115.04,36.5 ; 77.37,8.98 v2(77.41,8.94) ; 77.37,8.98 78.05,9.67 78.05,11.12 U2.18 ; 115.04,36.5 115.04,26.24 110.16,21.36 110.16,20.96 109.57,20.37 v2(109.4,20.37) 108.85,20.37 99.89,11.4 99.89,10.66 R11.1 98.99,9.79 96.86,7.66 87.07,7.66 86.97,7.76 81.39,7.76 81.35,7.8 ; U1.3 38.84,46.25 29.85,37.26 v2(11.32,37.26) ; 55.68,43.8 R1.1 55.68,48.47 58.11,50.91 61.65,50.91 65.21,54.46 J2.1 ; 55.68,43.8 52.64,43.8 52.38,43.55 52.38,43.16 ; C4.1 49.2,42.57 49.8,43.16 52.38,43.16 ; v2(79.18,6.11) 79.66,6.11 81.35,7.8 ; 52.38,42.52 52.38,43.16
  Bottom Layer w0.5: v2(109.4,20.37) 110.21,19.56 J5.2 ; v2(45.77,43.3) v2(48.47,43.3) ; v2(104.51,36.87) J4.5 ; v2(70.05,10.05) 67.67,10.05 67.3,10.42 67.3,10.92 v2(64.94,13.28) ; S1.3 3.9,38.4 5.16,39.67 11.02,39.67 11.32,39.37 v2(11.32,37.26) 10.67,36.61 R4.1 ; J3.1 v2(79.18,6.11) 77.41,7.87 v2(77.41,8.94) ; v2(137,39.18) 137.23,39.18 R7.1 138.92,39.29 140.71,39.29 S2.3
GND: length 41
  Top Layer w0.25: U3.16 U3.15 53.88,18.92 U3.17 U3.17 U3.17 50.63,22.17 U3.7 ; v1(94.09,24.35) 94.83,23.61 U4.16 95.48,23.42
  Top Layer w0.3: 94.15,10.7 92.55,10.7 ; v2(91.25,10.83) 92.03,10.83 v2(93.3,12.1) ; v2(95.7,13.4) 95.7,14.21 R15.2 ; R17.2 94.48,40.06 v1(94.48,39.61) ; 84.1,13.8 v2(83.55,13.7) ; 98.73,18.45 98.73,19.52 ; 113.25,43.73 v1(113.14,43.08) ; 51.08,39.32 v1(50.38,39.32) ; 46.55,13.85 v1(46.55,13.15) ; 143.25,36.35 v1(143.16,35.7) ; 51.5,46.11 v1(52.2,46.11) ; 95.7,46.82 v1(96.4,46.82)
  Top Layer w0.4: R14.2 50.63,26.13 U3.7
  Bottom Layer w0.3: 86.3,12.2 86.3,11.4 v2(86.8,10.9) ; 95.5,13.2 94.3,13.2 ; 94.5,19.5 94.4,19.4 94.4,16.7 94.2,16.5 94.2,13.2 94.1,13.1 94.1,13 93.3,12.2 v2(93.3,12.1) ; v2(87.55,9.22) 88.4,10.07 88.4,10.2 88.8,10.6 88.9,10.6 89.13,10.83 v2(91.25,10.83)
  vias: v1(8.31,38.82) v1(69.29,7.06) v2(76.29,12.57) v2(82.1,11.25) v2(86.16,12.43) v2(88.8,10.8) v2(92.3,10.8) v2(94.6,19.7) v2(96.15,11.46) v2(98.74,14.46) v2(102.67,27.41) v2(112.07,20.3)
VBAT: length 183.5
  Top Layer w0.4: 51.28,15.9 51.08,15.9 ; 98.08,25.3 98,25.3
  Top Layer w0.5: 51.28,14.72 C11.1 ; U3.11 51.28,15.9 ; U4.11 98.08,25.3
  Top Layer w1: 51.08,14.25 51.08,15.9 ; R2.1 v1(88.46,12.7) v1(87.46,12.7)
  Top Layer w1.1: 98.08,25.3 98.08,26.75
  Top Layer w1.5: 56.95,35.53 55.69,34.27 C1.1 ; 56.95,35.53 57.46,36.05 57.46,41 56.76,41.7 55.56,41.7 ; 56.95,35.53 56.92,35.57 ; U1.1 45.99,46.25 47.05,45.19 47.05,38.31 48.17,37.19 57.21,37.19
  Top Layer w1.6: C14.1 C16.1 ; C13.1 C11.1 ; C17.1 98.74,33.82
  Top Layer w2: 49.59,13.82 49.59,10.73 J1.1
  Top Layer w2.2: M3.1 95.06,34.02 C2.1 ; M3.1 98.74,27.03 ; M3.1 98.74,33.82
  Bottom Layer w1: D1.1 98.1,27.56 98.74,28.2 M3.1
  Bottom Layer w1.5: 93.1,21 96.1,24 96.1,31.5 C2.1 ; 93.02,20.81 93.02,13.7 92.51,13.19 ; 92.26,12.93 92.03,12.7 v1(88.46,12.7) v1(87.46,12.7)
  Bottom Layer w2.5: C2.1 92.39,34.02 80.07,46.33 65.72,46.33 C1.1 53.65,31.6 43.11,21.06 43.11,12.13 J1.1
VBAT_A7: length 20.9
  Top Layer w0.25: C6.1 89.91,9.41 89.97,9.46 R3.1 R2.2 88.62,15.6 83.51,15.6 v2(83.15,15.24) ; U2.22 76.83,14.43 77.83,14.43 78.32,13.94 79.73,13.94 80.12,14.33 82.24,14.33 v2(82.56,14.65)
  Bottom Layer w0.25: v2(83.15,15.24) v2(82.56,14.65)
AREF: length 9.3
  Top Layer w0.25: U2.20 78.14,13.47 79.27,13.47 79.72,13.02 84.66,13.02 C8.1
B1_D11: length 63.3
  Top Layer w0.25: SW2.1 106.32,38.2 v2(105.81,37.68) ; v2(97.57,11.47) 95.01,8.91 v2(90.83,8.91) ; v2(79.81,7.35) 79.71,7.45 ; 79.71,7.45 79.48,7.45 U2.15
  Bottom Layer w0.25: 108.13,27.13 109.35,25.91 109.35,23.37 J5.4 ; 108.13,27.13 105.81,29.45 v2(105.81,37.68) ; 108.13,27.13 97.57,16.56 v2(97.57,11.47) ; v2(79.81,7.35) 83.01,4.15 85.89,4.15 86.21,4.47 86.21,5.52 89.61,8.91 v2(90.83,8.91)
B2_D12: length 71.9
  Top Layer w0.25: v2(114.17,37.65) 114.13,37.61 112.05,37.61 106.32,43.33 SW3.1 ; v2(80.29,9.24) 79.93,8.88 U2.16 ; v2(89.3,9.91) 88.69,9.91 86.92,11.68 83.7,11.68 v2(83,10.97)
  Bottom Layer w0.25: v2(83,10.97) 83,10.4 81.84,9.24 v2(80.29,9.24) ; v2(89.3,9.91) 100.82,9.91 108.08,17.17 108.08,17.82 ; 108.08,17.82 111.05,17.82 113.28,20.05 113.28,35.48 114.49,36.68 114.49,37.33 v2(114.17,37.65) ; 108.08,17.82 J5.1
BT_RXD: length 4.9
  Bottom Layer w0.25: J4.2 103.06,43.03 R21.1 R20.2
BT_TXD: length 5.5
  Top Layer w0.25: v2(101.52,44.72) 101.52,43.04 J4.3
  Bottom Layer w0.25: v2(101.52,44.72) R22.2
C0_A4: length 63
  Top Layer w0.25: v2(74.26,14.11) 73.67,13.52 72.27,13.52 71.85,13.95 ; v2(77.78,15.36) 84.39,21.97 84.39,55.89 82.86,57.41 74.5,57.41 J2.4
  Bottom Layer w0.25: v2(77.78,15.36) 75.51,15.36 v2(74.26,14.11)
CPH_A: length 4.9
  Top Layer w0.25: 52.58,17.68 52.58,16.08 54.41,14.25 C12.1
CPH_B: length 7.4
  Top Layer w0.3: C15.1 92.13,26.71 92.13,25.63 92.31,25.46 95.87,25.46 96.78,24.54 U4.13
CPL_A: length 5.5
  Top Layer w0.25: C12.2 55.36,15.44 54.17,15.44 53.23,16.38 U3.14
CPL_B: length 14.1
  Top Layer w0.25: C15.2 93.61,26.75 93.66,26.8 93.66,27.79 93.15,28.3 91.63,28.3 90.74,27.41 90.74,26.11 94.75,22.11 95.69,22.11 96.13,22.54 U4.14
DIRA_D3: length 24.7
  Top Layer w0.25: v2(68.05,10.94) 69.03,9.96 69.03,8.89 ; U3.2 53.88,24.2 54.49,24.81 54.99,24.81 55.71,24.09 v2(55.71,23.61)
  Bottom Layer w0.25: v2(55.71,23.61) 57.08,23.61 64.69,15.99 64.69,14.62 68.05,11.27 v2(68.05,10.94)
DIRB_D4: length 50.3
  Top Layer w0.25: v2(66.42,17.63) 64.95,17.63 63.02,15.69 v2(63.02,14.92) ; v2(83.72,16.77) 84.43,16.07 89.02,16.07 89.2,15.89 90.74,15.89 91.31,16.46 95.47,16.46 95.48,16.48 95.48,17.68 ; v2(67.99,19.34) 69.42,20.78 78.85,20.78 ; U2.2 69.12,7.85 v2(67.96,7.85)
  Bottom Layer w0.25: v2(67.96,7.85) 67.21,7.85 65.56,9.5 65.56,11.75 63.02,14.29 v2(63.02,14.92) ; v2(83.72,16.77) 82.86,16.77 78.85,20.78 ; v2(67.99,19.34) 67.99,19.2 v2(66.42,17.63)
  vias: v2(78.85,20.82)
DRV_SLEEP: length 50.4
  Top Layer w0.25: 80.95,20.86 80.87,20.86 79.53,22.2 v2(65.09,22.2) ; v2(84.72,18.96) 84.72,18.96 96.06,18.96 96.13,18.89 U4.3 ; v2(54.09,25.36) 53.62,25.36 53.24,25.74 ; R13.2 53.24,25.74 ; 53.24,25.74 53.24,23.43 U3.3
  Bottom Layer w0.25: v2(84.72,18.96) 82.85,18.96 80.95,20.86 ; v2(54.09,25.36) 61.92,25.36 v2(65.09,22.2)
  vias: v2(80.95,20.82)
DTR: length 22.4
  Top Layer w0.25: v2(83.5,9.03) 83.91,9.44 C18.1 ; v2(71.47,10.39) 76.31,10.39 v2(76.98,9.71)
  Bottom Layer w0.25: v2(83.5,9.03) 82.4,7.93 80.67,7.93 80.49,8.11 79.79,8.11 78.19,9.71 v2(76.98,9.71) ; J3.5 71.47,6.88 v2(71.47,10.39)
IPROPI_A: length 3.5
  Top Layer w0.25: U3.6 51.28,26.06 51.36,26.13 R14.1
IPROPI_B: length 3.3
  Top Layer w0.25: 98.08,17.68 98.08,15.66 97.59,15.17 R15.1
LEDA_D2: length 79.7
  Top Layer w0.25: U2.32 68.41,11.73 67.89,11.73 67.64,11.48 55.85,11.48 50.06,5.7 45.85,5.7 41.64,9.9 41.64,22.64 28.4,35.88 v2(13.16,35.88)
  Bottom Layer w0.25: R6.1 v2(13.16,35.88)
LEDB_D7: length 88.5
  Top Layer w0.25: 76.35,6.05 76.97,5.44 86.01,5.44 87.02,6.44 95.53,6.44 100.73,1.25 103.11,1.25 105.82,3.96 109.82,3.96 110.88,5.02 110.88,21.19 123.57,33.88 123.57,34.95 124.6,35.98 v2(134.67,35.98)
  Bottom Layer w0.25: v2(134.67,35.98) 134.93,36.24 134.93,37.43 R9.1
LEDC_D13: length 76.1
  Top Layer w0.25: v2(87.26,36.67) 93.14,42.55 93.15,42.55 93.15,43.29 ; v2(86.24,9.27) 86.24,9.07 85.56,8.39 82.1,8.39 v2(81.88,8.61) ; v2(96.63,13.33) 96.71,13.41 100.62,13.41 108.55,21.33 v2(109.34,21.33) ; v2(94.78,20.59) 94.78,20.87 v2(90.4,25.25) ; 79.17,11.11 79.54,10.73 v2(79.54,9.79)
  Bottom Layer w0.25: v2(81.88,8.61) 79.98,8.61 79.54,9.06 v2(79.54,9.79) ; v2(90.4,25.25) 87.26,28.39 v2(87.26,36.67) ; J5.3 108.58,22.1 v2(109.34,21.33) ; v2(94.78,20.59) 96.63,18.74 v2(96.63,13.33) 94.35,11.05 93.12,11.05 92.58,11.59 88.71,11.59 86.38,9.27 v2(86.24,9.27)
MARK_L_A5: length 78.7
  Top Layer w0.25: 70.67,13.83 70.57,13.93 70.17,13.93 69.27,14.83 64.13,14.83 v2(64.03,14.94) ; v2(9.92,38.73) 11.02,39.83 16.37,39.83 18.07,38.13 v2(28.74,38.13) ; v2(28.74,36.51) 42.37,22.89 42.37,18.17 v2(45.08,15.46)
  Bottom Layer w0.25: v2(64.03,14.94) 63.42,15.55 45.17,15.55 v2(45.08,15.46) ; 7.37,38.03 7.87,37.53 9.37,37.53 9.87,38.03 ; v2(28.74,36.51) v2(28.74,38.13)
MARK_R_A6: length 101.9
  Top Layer w0.25: v2(144.36,39.24) 138.07,39.24 ; 138.07,39.24 137.45,39.86 113.95,39.86 106.49,47.32 102.32,47.32 100.23,45.23 100.23,41.36 99.49,40.62 97.15,40.62 89.75,33.23 89.75,25.05 80.47,15.77 v2(80.47,14.98) ; 138.07,39.24 135.93,37.1 135.93,37 137.28,35.65 v2(137.64,35.65) ; U2.19 78.8,13 78.92,13 79.59,12.33 v2(80.47,12.33)
  Bottom Layer w0.25: v2(144.36,39.24) 144.76,39.24 S2.4 ; v2(137.64,35.65) 138.02,36.03 R8.1 ; v2(80.47,12.33) v2(80.47,14.98)
OUT_A1: length 18.5
  Top Layer w1.5: M1.2 42.73,34.52 46.31,30.94 46.31,25.36 48.09,23.58 49.48,23.58
OUT_A2: length 23.9
  Top Layer w0.4: U3.10 50.63,16.73 49.97,16.07
  Top Layer w1.3: 49.61,16.02 48.71,16.02
  Top Layer w1.5: 43.61,28.94 43.61,21.12 48.71,16.02 ; M1.1 40.57,31.98 43.62,28.94
OUT_B1: length 22.5
  Top Layer w1.5: M2.2 110.17,32.75 112.2,30.71 112.2,28.63 101.24,17.68 100.01,17.68
OUT_B2: length 19
  Top Layer w0.41: 98.74,23.43 98.74,24.49 98.99,24.75 100.09,24.75
  Top Layer w1.5: M2.1 107.5,35.29 105.72,33.51 105.72,28.43 102.26,24.97 100.13,24.97
OUT_C: length 14.6
  Top Layer w1: Q1.3 101.6,40.11 101.6,30.66 M3.2
  Bottom Layer w1: M3.2 D1.2
PWMA_D5: length 32.6
  Top Layer w0.25: v2(56.9,19.04) 65.92,19.04 70.14,14.82 70.56,14.82 v2(70.69,14.69) ; U2.9 74.55,5.59 v2(74.55,8.11) ; U3.1 54.53,21.88 v2(55.03,21.38)
  Bottom Layer w0.25: v2(70.69,14.69) 74.55,10.82 v2(74.55,8.11) ; v2(56.9,19.04) 55.03,20.92 v2(55.03,21.38)
PWMB_D6: length 38.3
  Top Layer w0.25: v2(85.49,4.79) 76.48,4.79 U2.10 ; v2(91.22,17.94) 94.57,17.94 U4.1 ; v2(88.08,17.91) 83.95,17.91 81.75,15.7 v2(81.75,14.99)
  Bottom Layer w0.25: v2(81.75,14.99) 81.75,13.2 85.49,9.45 v2(85.49,4.79) ; v2(88.08,17.91) 88.08,18.53 88.58,19.03 90.86,19.03 91.22,18.67 v2(91.22,17.94)
PWMC_D10: length 49.3
  Top Layer w0.25: v2(79.33,14.96) 79.33,15.42 86.54,22.63 86.54,35.02 v2(94.1,42.58) ; v2(75.41,8.19) 75.44,8.16 77.64,8.16 U2.14 ; R16.1 95.69,44.31 95.44,44.06 94.94,44.06 94.69,43.8 v2(94.69,43.17)
  Bottom Layer w0.25: v2(75.41,8.19) 75.41,10.43 75.42,10.45 ; 75.42,10.45 75.37,12.75 76.03,13.4 77.77,13.4 v2(79.33,14.96) ; 75.42,10.45 75.42,10.54 ; v2(94.69,43.17) v2(94.1,42.58)
RESET: length 72.9
  Top Layer w0.25: v2(81.87,10.31) 84.43,10.31 84.69,10.56 85.28,10.56 ; 102.22,3.24 102.22,12.62 v2(106.34,16.74) ; 102.22,3.24 98.44,7.01 v2(86.66,7.01) ; 102.22,3.24 SW1.2 ; v2(77.29,10.78) 76.18,11.89 71.65,11.89 70.72,12.81 70.42,12.81 68.98,14.25 R10.2 ; 85.28,10.56 85.86,10.56 86.89,9.54 86.89,8.69 v2(86.73,8.53) ; 85.28,10.56 C18.2
  Bottom Layer w0.25: v2(106.34,16.74) 106.3,16.78 106.3,22.86 J5.5 ; v2(77.29,10.78) 81.4,10.78 v2(81.87,10.31) ; v2(86.66,7.01) 86.73,7.08 v2(86.73,8.53)
RX_D0: length 68
  Top Layer w0.25: 70.15,12.25 71.37,11.03 v2(72.23,11.03) ; v2(85.03,29.5) 85.03,40.14 92.48,47.59 99.09,47.59 v2(100.02,46.67)
  Bottom Layer w0.25: v2(85.03,29.5) 85.03,29.33 73.4,17.69 70.83,17.69 68.96,15.82 68.96,14.28 72.2,11.03 v2(72.23,11.03) 73.72,9.54 73.72,6.27 74.1,5.89 J3.3 ; R22.1 v2(100.02,46.67)
S0_A0: length 44.9
  Top Layer w0.25: U2.23 75.78,14.61 83.79,22.62 83.79,41.98 82.99,42.78 J2.8
S1_A1: length 45.2
  Top Layer w0.25: 75.21,15.07 77.68,17.54 v2(77.68,17.93) ; v2(83,36.3) 83,40.48 80.45,43.03 J2.7 ; v2(83.03,29.2) 83.24,28.98 83.24,26.5 v2(79.79,23.05)
  Bottom Layer w0.25: v2(83,36.3) 83,33.67 arc(83.02,33) 83,32.33 83,29.22 v2(83.03,29.2) ; v2(77.68,17.93) 77.68,20.83 79.79,22.94 v2(79.79,23.05)
S2_A2: length 50.8
  Top Layer w0.25: v2(69.93,17.83) 72.13,15.63 72.43,15.63 U2.25 ; v2(69.93,22.93) 63.43,29.43 63.43,41.26 J2.6
  Bottom Layer w0.25: v2(69.93,22.93) v2(69.93,17.83)
S3_A3: length 51.7
  Top Layer w0.25: U2.26 70.31,16.62 69.67,16.62 61.65,24.64 61.65,42.02 J2.5
TX_D1: length 75.8
  Top Layer w0.25: 67.11,12.32 66.77,12.32 66.75,12.3 66.01,12.3 ; 67.11,12.32 v2(67.11,13.59) ; 67.11,12.32 68.95,12.32 U2.31 70.81,10.46 70.81,10.12 71.66,9.27 v2(72.92,9.27) ; v2(97.52,42.24) 97.52,44.63 96.45,45.7 95.27,45.7 94.04,44.47 94.04,44.18 93.9,44.04 91.5,44.04 85.69,38.23 85.69,23.47 85.24,23.03 ; 68.64,18.6 77.56,18.6 79.78,20.82 v2(79.96,20.82)
  Bottom Layer w0.25: v2(97.52,42.24) 97.52,42.12 99.27,40.37 R20.1 ; J3.4 71.56,5.89 72.92,7.25 v2(72.92,9.27) ; v2(68.64,18.6) 67.11,17.08 v2(67.11,13.59) ; 85.24,23.03 82.16,23.03 v2(79.96,20.82)
  vias: v2(85.24,23.05)
VCP_A: length 3.5
  Top Layer w0.25: U3.12 51.93,15.33 52.21,15.04 C11.2
VCP_B: length 3.9
  Top Layer w0.25: U4.12 97.43,24.66 95.96,26.12 95.96,26.75
VREF: length 61.1
  Top Layer w0.25: 94.96,12.16 R11.2 ; 94.96,12.16 94.96,14.24 ; 94.96,12.16 R12.1 ; U4.5 97.43,16.73 96.7,16 95.5,16 94.96,15.45 94.96,14.24 ; v2(56.93,21.06) 64.57,21.06 69.65,15.98 v2(70.03,15.98) ; v2(52.59,25.4) 51.93,24.74 U3.5 ; 94.96,14.24 v2(90.91,14.24)
  Bottom Layer w0.25: v2(70.03,15.98) 70.14,16.09 89.06,16.09 v2(90.91,14.24) ; v2(52.59,25.4) 52.71,25.4 56.93,21.18 v2(56.93,21.06)
XTAL1: length 18.4
  Top Layer w0.25: U2.7 73.39,6.46 73.72,6.46 74.04,6.14 74.04,4.11 73.72,3.79 65.45,3.79 X1.1 63.79,8.54 C9.1
XTAL2: length 9.3
  Top Layer w0.25: 72.99,4.93 72.48,4.43 69.66,4.43 68.64,5.44 X1.2 66.73,6.6 C10.1
$1N2048: length 2.1
  Bottom Layer w0.25: R4.2 7.93,36.61 7.92,36.6 S1.1
$1N2069: length 6.8
  Bottom Layer w0.25: R7.2 139.59,38.39 140.41,37.57 144.63,37.57 S2.1
$1N2070: length 5.5
  Top Layer w0.25: LED1.2 50.61,47.01 52.37,47.01 53.42,45.95 R1.2
$1N2073: length 9.4
  Top Layer w0.25: v2(12.27,39.1) 12.05,39.1 10.72,37.78 7.57,37.78 7.05,38.3 LED2.2
  Bottom Layer w0.25: v2(12.27,39.1) 12.38,38.99 12.38,38.19 R6.2
$1N2082: length 8.4
  Top Layer w0.25: LED3.2 138.09,38.3 v2(136.82,37.04)
  Bottom Layer w0.25: R9.2 136.6,36.82 v2(136.82,37.04)
$1N2129: length 2.3
  Top Layer w0.25: 93.15,44.8 93.15,45.54 93.71,46.1 93.75,46.1 LED4.2
$1N2130: length 3.5
  Top Layer w0.25: 64.41,12.3 63.67,12.3 63.66,12.3 R19.2
$1N2219: length 6.2
  Top Layer w0.25: Q1.1 95.69,41.57 ; R17.1 95.43,41.39 95.6,41.57 95.69,41.57 ; 95.69,41.57 R16.2

## Copper pours and planes (outline as drawn; the poured copper is in the pictures)
GND on Top Layer: -5.02,63.99 150.3,63.99 150.3,-5.23 -5.02,-5.23
GND on Bottom Layer: -8.2,74.02 152.2,74.02 152.2,-5.61 -8.2,-5.61
